# EAGLE design smart switch (EAGLE 9.6.2)
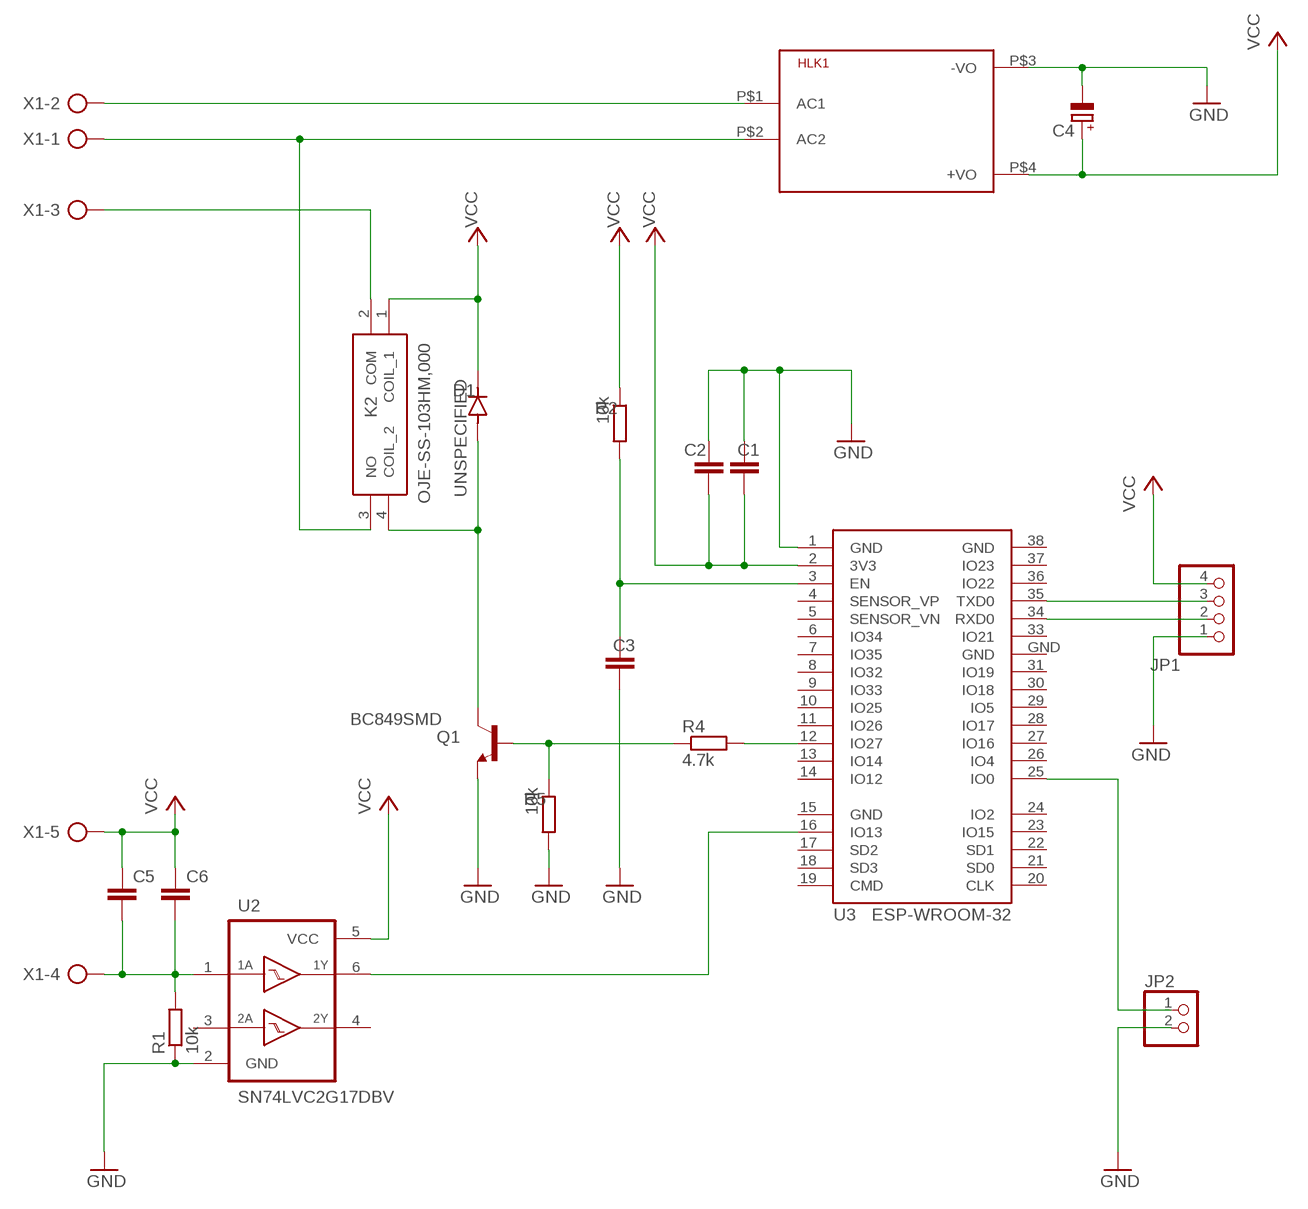
[diagram p0: schematic, sheet 1]

## Parts
C1  C-EUC1206  [C1206]
C2  C-EUC1206  [C1206]
C3  C-EUC1206  [C1206]
C4  CPOL-EUE2-5  [E2-5]
C5  C-EU025-024X044  [C025-024X044]
C6  C-EUC1206  [C1206]
D1  UNSPECIFIED  FLYBACK-DIODE  [DIODE-LEGACY-R3]
HLK1  HLK-PM013W  [HLK-PM01]
JP1  PINHD-1X4  [1X04]
JP2  PINHD-1X2  [1X02]
K2  OJE-SS-103HM,000  [OJESS103HM000]
Q1  BC849SMD  [SOT23-BEC]
R1  10k  R-EU_R1206  [R1206]
R2  10k  R-EU_R1206  [R1206]
R4  4.7k  R-EU_R1206  [R1206]
R5  10k  R-EU_R1206  [R1206]
U2  SN74LVC2G17DBV  [SOT23-6]
U3  ESP-WROOM-32  [ESP-WROOM-32]
X1  AK500/5  [AK500/5]

## Nets
GND: C1.1 C2.1 C3.2 C4.- HLK1.P$3(-VO) JP1.1 JP2.2 Q1.E R1.1 R5.2 U2.2(GND) U3.1(GND)
N$1: K2.2(COM) X1.3
N$2: D1.A K2.4(COIL_2) Q1.C
N$3: JP1.3 U3.35(TXD0)
N$4: C5.2 C6.2 R1.2 U2.1(1A) X1.4
N$5: JP1.2 U3.34(RXD0)
N$6: JP2.1 U3.25(IO0)
N$7: R4.2 U3.12(IO27)
N$8: C3.1 R2.2 U3.3(EN)
N$9: U2.6(1Y) U3.16(IO13)
N$10: HLK1.P$2(AC2) K2.3(NO) X1.1
N$11: HLK1.P$1(AC1) X1.2
N$16: Q1.B R4.1 R5.1
VCC: C1.2 C2.2 C4.+ C5.1 C6.1 D1.K HLK1.P$4(+VO) JP1.4 K2.1(COIL_1) R2.1 U2.5(VCC) U3.2(3V3) X1.5
Unconnected: U2.3(2A) U2.4(2Y) U3.4(SENSOR_VP) U3.5(SENSOR_VN) U3.6(IO34) U3.7(IO35) U3.8(IO32) U3.9(IO33) U3.10(IO25) U3.11(IO26) U3.13(IO14) U3.14(IO12) U3.17(SD2) U3.18(SD3) U3.19(CMD) U3.20(CLK) U3.21(SD0) U3.22(SD1) U3.23(IO15) U3.24(IO2) U3.26(IO4) U3.27(IO16) U3.28(IO17) U3.29(IO5) U3.30(IO18) U3.31(IO19) U3.33(IO21) U3.36(IO22) U3.37(IO23)

## Power pins joined to a net without a drawn wire
GND: U3.15(GND) U3.38(GND) U3.GND

## Library data of the parts
C1-C3 = resistor:C-EU: CAPACITOR, European symbol
C4 = rcl:CPOL-EU: POLARIZED CAPACITOR, European symbol; SPICEPREFIX: C
C5 C6 = rcl:C-EU: CAPACITOR, European symbol; SPICEPREFIX: C
D1 = SmartSwitch-local:FLYBACK-DIODE: Generic flyback diode: cathode K to VCC, anode A to relay-coil/Q1 collector. Part number unspecified; verify ratings and package before manufacture.
HLK1 = HLK-PM01:HLK-PM01: Hi-Link Power Supply HLK-PM01 3W Author: Ahmed Said <https://github.com/AhmedSaid/EAGLELibraries>
JP1 = pinhead:PINHD-1X4: PIN HEADER
JP2 = pinhead:PINHD-1X2: PIN HEADER
K2 = OJE-SS-103HM_000:OJE-SS-103HM,000: TE CONNECTIVITY / OEG - OJE-SS-103HM,000 - RELAY, SPST-NO, 250VAC, 30VDC, 10A Source: Datasheet <https://www.te.com/commerce/DocumentDelivery/DDEController?Action=showdoc&DocId=Customer Drawing1461103FpdfEnglishENG_CD_1461103_F.pdf1461103-1>; DESCRIPTION: TE CONNECTIVITY / OEG - OJE-SS-103HM,000 - RELAY, SPST-NO, 250VAC, 30VDC, 10A; HEIGHT: 15.1mm; MANUFACTURER_NAME: TE Connectivity; MANUFACTURER_PART_NUMBER: OJE-SS-103HM,000; MOUSER_PART_NUMBER: N/A; MOUSER_PRICE-STOCK: https://www.mouser.com/Search/Refine.aspx?Keyword=N%2FA
Q1 = transistor-npn:BC849*: NPN Transistor
R1 R2 R4 R5 = resistor:R-EU_: RESISTOR, European symbol
U2 = SN74LVC2G17:SN74LVC2G17: DUAL SCHMITT-TRIGGER BUFFER; AVAILABILITY: Unavailable; DESCRIPTION: Dual Schmitt-Trigger Buffer; MF: Texas Instruments; MP: SN74LVC2G17; PACKAGE: XFDFN-6 Texas Instruments; PRICE: None
U3 = esp322:ESP-WROOM-32: Espressif Systems ESP-WROOM-32
X1 = con-ptr500:AK500/5: CONNECTOR; OC_FARNELL: unknown; OC_NEWARK: unknown

## Board
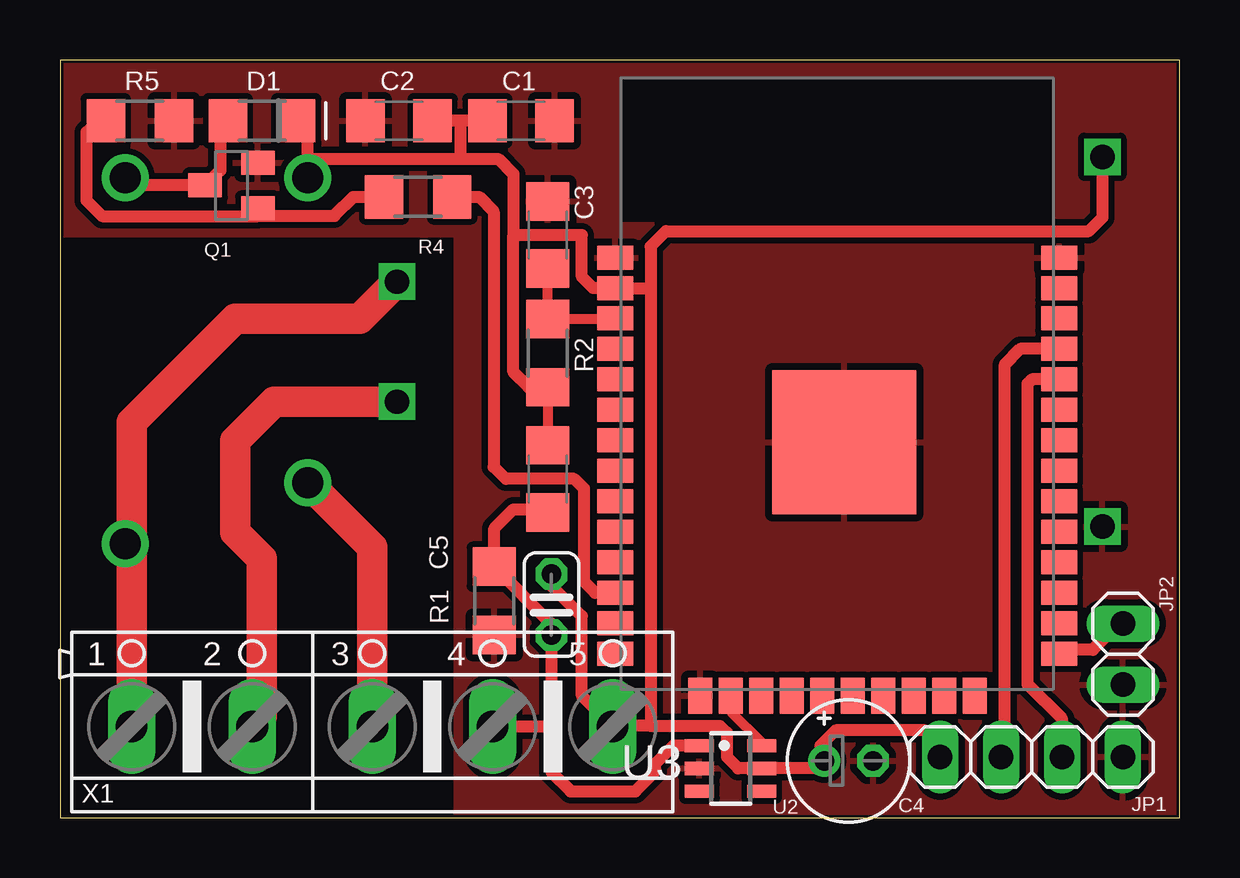
[diagram p1: board, top side]
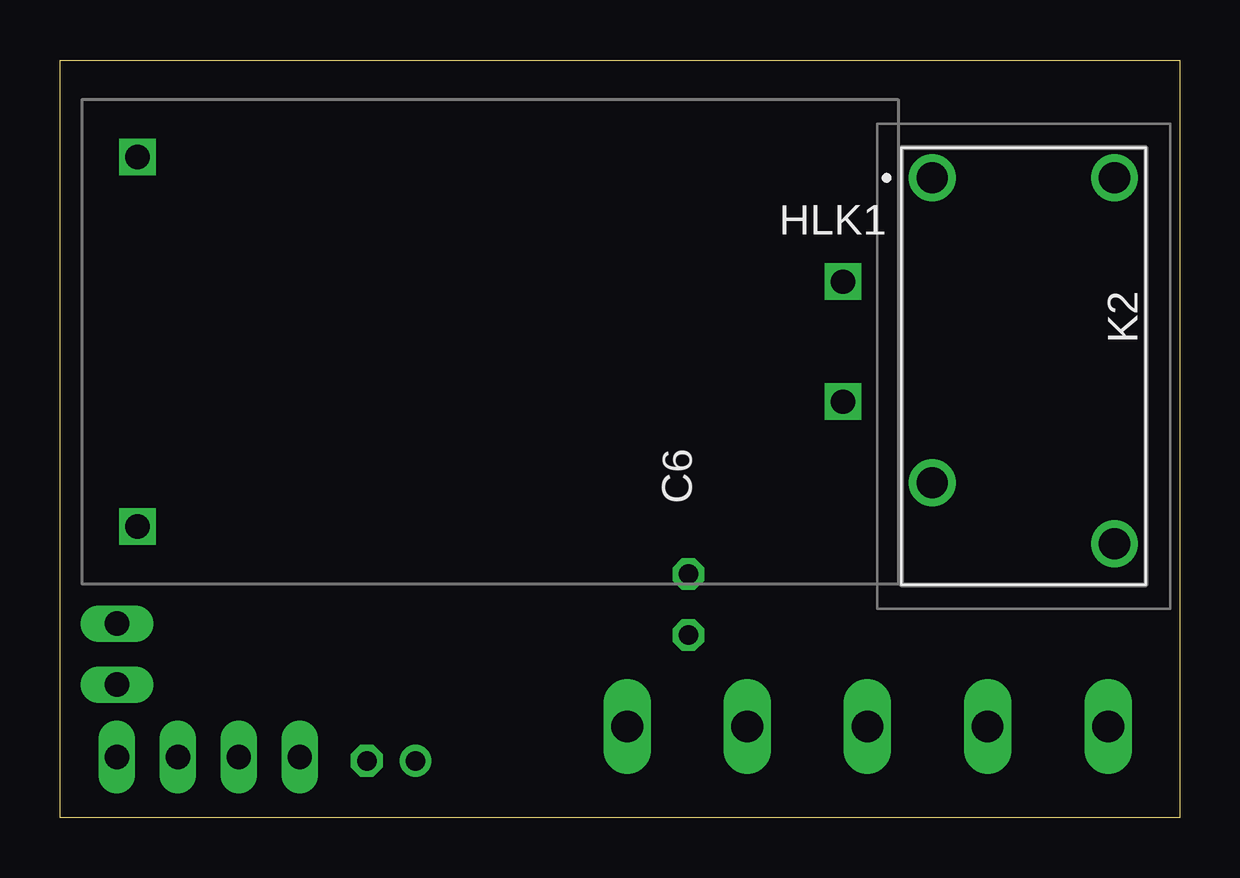
[diagram p2: board, bottom side, seen from below]

Size 46.66 x 31.58 mm. Coordinates in mm from the lower left corner, seen from the top.
Outline: 0,0 46.66,0 46.66,31.58 0,31.58 0,0
Copper layers (1*16): Top 0.035mm / dielectric 1.5mm / Bottom 0.035mm
Design rules "default *": minimum track width 10mil, minimum drill 0.35mm, track to track 10mil, track to pad 10mil, pad to pad 10mil, via to via 8mil, smd to smd 8mil, copper to edge 5mil, drill to drill 6mil, minimum pad ring 10mil, minimum via ring 8mil, stop-mask expansion 4mil, vias tented up to drill 0mil, thermal gap 12mil

### Footprints (pad centres in the part's own frame; a part is rotated, then mirrored left to right if it is on the bottom)
C1206 = smd 1.6 x 1.8: 1 -1.4,0; 2 1.4,0
E2-5 = drill 0.813 pad 1.27: + -1.016,0 | drill 0.813 pad 1.27 octagon: - 1.016,0
C025-024X044 = drill 0.813 octagon: 1 -1.27,0; 2 1.27,0
DIODE-LEGACY-R3 = smd 1.6 x 1.803: A 1.422,0; K -1.422,0
HLK-PM01 = drill 1.016 square: P$1 -14.7,2.5; P$2 -14.7,-2.5; P$3 14.7,7.7; P$4 14.7,-7.7
1X04 = drill 1.016 long: 1 -3.81,0; 2 -1.27,0; 3 1.27,0; 4 3.81,0
1X02 = drill 1.016 long: 1 -1.27,0; 2 1.27,0
OJESS103HM000 = drill 1.3 pad 1.95: 1 0,0; 2 12.7,0; 3 15.24,7.6; 4 0,7.6
SOT23-BEC = smd 1 x 1.4: B -0.95,-1.1; C 0,1.1; E 0.95,-1.1
R1206 = smd 1.6 x 1.803: 1 -1.422,0; 2 1.422,0
SOT23-6 = smd 0.55 x 1.2: 1 -0.95,-1.3; 2 0,-1.3; 3 0.95,-1.3; 4 0.95,1.3; 5 0,1.3; 6 -0.95,1.3
ESP-WROOM-32 = smd 1.5 x 1: 1 -9.25,7; 2 -9.25,5.73; 3 -9.25,4.46; 4 -9.25,3.19; 5 -9.25,1.92; 6 -9.25,0.65; 7 -9.25,-0.62; 8 -9.25,-1.89; 9 -9.25,-3.16; 10 -9.25,-4.43; 11 -9.25,-5.7; 12 -9.25,-6.97; 13 -9.25,-8.24; 14 -9.25,-9.51; 25 9.25,-9.51; 26 9.25,-8.24; 27 9.25,-6.97; 28 9.25,-5.7; 29 9.25,-4.43; 30 9.25,-3.16; 31 9.25,-1.89; 32 9.25,-0.62; 33 9.25,0.65; 34 9.25,1.92; 35 9.25,3.19; 36 9.25,4.46; 37 9.25,5.73; 38 9.25,7 | smd 1 x 1.5: 15 -5.7,-11.25; 16 -4.43,-11.25; 17 -3.16,-11.25; 18 -1.89,-11.25; 19 -0.62,-11.25; 20 0.65,-11.25; 21 1.92,-11.25; 22 3.19,-11.25; 23 4.46,-11.25; 24 5.73,-11.25 | smd 6 x 6: GND 0.3,-0.7
AK500/5 = drill 1.321 long: 1 -10.033,0; 2 -5.004,0; 3 0,0; 4 5.004,0; 5 10.008,0

### Placement (x,y rotation side)
C1  19.21,29.05 180 top
C2  14.13,29.05 0 top
C3  20.32,24.29 90 top
C4  32.86,2.38 0 top
C5  20.48,8.89 270 top
C6  20.32,14.13 270 top
D1  8.41,29.05 180 top
HLK1  28.73,19.84 180 bottom
JP1  40.48,2.54 180 top
JP2  44.29,6.83 270 top
K2  10.32,26.67 270 bottom
Q1  7.14,26.35 90 top
R1  18.1,9.05 90 top
R2  20.32,19.37 90 top
R4  14.92,25.88 0 top
R5  3.33,29.05 0 top
U2  27.94,2.06 270 top
U3  32.39,16.35 0 top
X1  13.02,3.81 0 top

### Tracks (layer width: path | path; a pad name or v marks a point on that pad's centre or on a via)
GND
  Top 0.254: U3.38 41.59,23.39
  Top 0.406: C3.2 20.52,25.89 | U3.1 22.7,23.35
  Top 0.508: 20.84,26.21 C3.2
  Top 0.61: 26.67,5.09 U3.15
  pour Top: 0,31.59 46.67,31.59 46.67,0 16.51,0 16.51,24.29 0,24.29
N$1
  Top 1.27: X1.3 13.02,11.27 K2.2
N$2
  Top 0.406: Q1.C 6.51,26.51 | D1.A 6.68,29.05
  Top 0.508: K2.4 3.04,26.35 Q1.C 6.68,26.99 6.68,29.05
N$3
  Top 0.508: U3.35 40.02,19.54 39.37,18.89 39.37,2.7 JP1.3
N$4
  Top 0.406: 18.26,10.47 R1.2
  Top 0.508: 18.1,10.67 R1.2 | U2.1 25.56,3.01 24.79,2.24 24.79,1.93 23.97,1.11 21.27,1.11 20.48,1.9 20.48,3.81 | 20.48,3.81 X1.4 | 20.48,3.81 C5.2 20.48,8.1 R1.2 | R1.2 18.1,12.06 18.89,12.86 20.19,12.86 C6.2
N$5
  Top 0.406: JP1.2 41.75,2.7
  Top 0.508: U3.34 40.5,18.27 40.32,18.1 40.32,5.56 41.75,4.13 JP1.2
N$6
  Top 0.406: JP2.1 44.13,8.1 | 41.79,7 U3.25
  Top 0.508: 44.13,8.1 43.04,7 41.79,7
N$7
  Top 0.406: U3.12 23.12,9.37
  Top 0.508: U3.12 22.3,9.38 21.84,9.84 21.84,13.72 21.43,14.13 18.57,14.13 18.07,14.63 18.07,25.27 17.46,25.88 R4.2
N$8
  Top 0.406: C3.1 R2.2 23.11,20.79 U3.3
N$9
  Top 0.406: 27.78,4.93 U3.16 27.95,4.43 29.24,3.14 U2.6
N$10
  Top 1.27: HLK1.P$2 12.49,20.8 7.3,20.8 2.98,16.48 2.98,11.43 | 2.98,11.43 X1.1 | K2.3 2.98,11.43
N$11
  Top 1.27: HLK1.P$1 8.93,17.34 7.3,15.72 7.3,11.91 8.41,10.79 8.41,4.21 X1.2
N$16
  Top 0.406: R5.1 1.59,28.73 | R5.1 1.75,28.89 | 8.24,25.08 8.24,25.09 Q1.B 7.93,25.09 7.93,25.08 | R5.1 1.59,29.05
  Top 0.508: 8.24,25.08 1.75,25.08 1.11,25.72 1.11,28.58 1.59,29.05 | 7.93,25.08 11.44,25.08 12.23,25.88 R4.1
VCC
  Top 0.406: 20.16,18.1 R2.1 C6.1 | U3.2 23.15,22.07 | K2.1 10.32,27.46 | U3.2 23.13,22.18 | 22.98,21.92 U3.2 | U3.2 23.97,22.08 | U3.2 22.99,22.23 | D1.K 10.31,29.06 10.32,29.05 | 23.47,3.84 23.44,3.81
  Top 0.508: C1.2 16.67,29.05 | 16.67,29.05 C2.2 15.56,29.05 | 16.67,29.05 16.67,27.46 | 10.32,27.46 16.67,27.46 | 16.67,27.46 18.26,27.46 18.89,26.83 18.89,24.29 | JP1.4 36.67,3.02 36.04,3.65 32.32,3.65 31.69,3.02 31.69,2.54 C4.+ 31.53,2.06 U2.5 28.26,2.06 27.78,2.54 27.78,3.55 27.49,3.84 24.61,3.84 | HLK1.P$4 43.43,25.02 42.86,24.45 25.24,24.45 24.61,23.81 24.61,22.08 | K2.1 10.32,29.05 | 23.44,3.81 X1.5 21.75,5.09 21.75,8.41 20.48,9.68 C5.1 | 24.61,3.84 23.47,3.84 | 24.61,22.08 24.61,3.84 | 24.61,22.08 U3.2 22.21,22.08 21.75,22.54 21.75,24.29 18.89,24.29 | R2.1 19.53,17.95 19.53,17.94 18.89,18.57 18.89,24.29